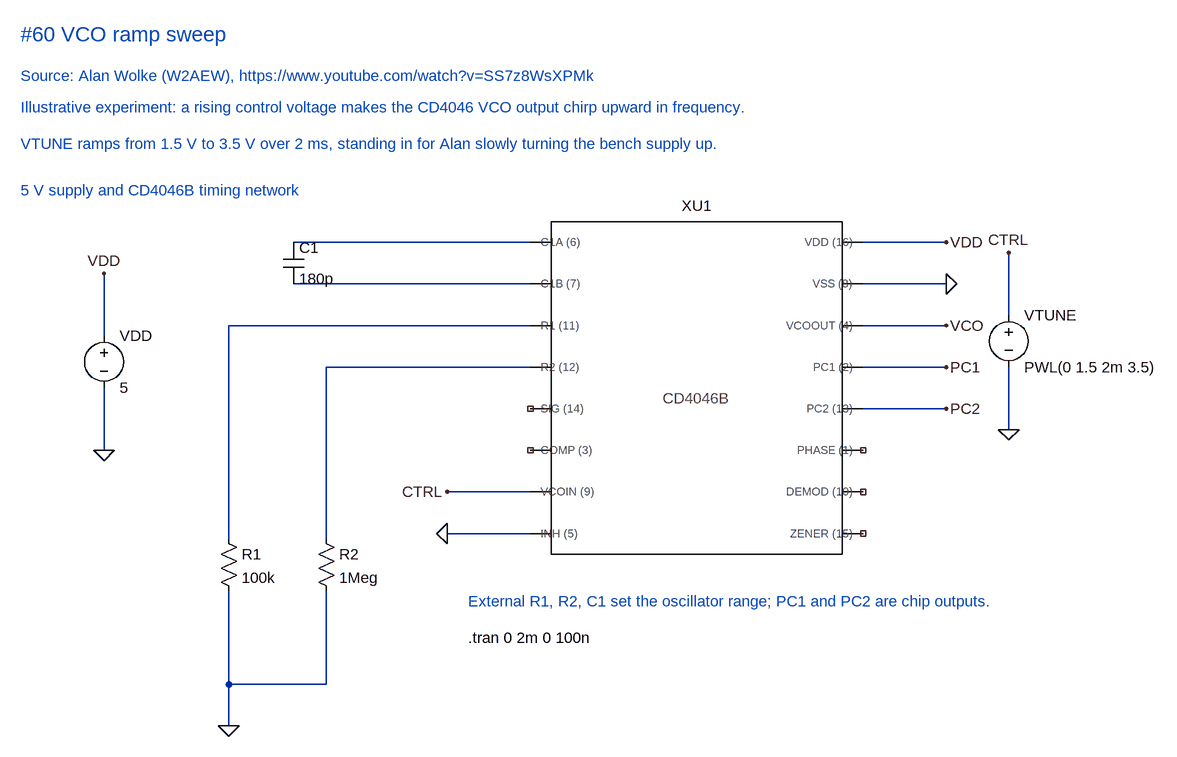
[diagram p0: schematic VCO ramp sweep.asc]
VCO ramp sweep.asc, the LTspice schematic file:
Version 4.1
SHEET 1 3100 1900
WIRE 864 -16 500 -16
WIRE 1504 -16 1376 -16
WIRE 864 48 500 48
WIRE 1504 48 1376 48
WIRE 1600 96 1600 0
WIRE 864 112 400 112
WIRE 1504 112 1376 112
WIRE 208 128 208 32
WIRE 864 176 550 176
WIRE 1504 176 1376 176
WIRE 1504 240 1376 240
WIRE 1600 272 1600 176
WIRE 208 304 208 208
WIRE 864 368 736 368
WIRE 864 432 736 432
WIRE 400 440 400 112
WIRE 550 440 550 176
WIRE 400 664 400 520
WIRE 550 664 550 520
WIRE 550 664 400 664
WIRE 400 728 400 664
FLAG 208 32 VDD
FLAG 208 304 0
FLAG 400 728 0
FLAG 736 368 CTRL
FLAG 736 432 0
FLAG 1504 -16 VDD
FLAG 1504 48 0
FLAG 1504 112 VCO
FLAG 1504 176 PC1
FLAG 1504 240 PC2
FLAG 1600 0 CTRL
FLAG 1600 272 0
SYMBOL voltage 208 112 R0
SYMATTR InstName VDD
SYMATTR Value 5
SYMBOL cap 484 -16 R0
SYMATTR InstName C1
SYMATTR Value 180p
SYMBOL res 384 424 R0
SYMATTR InstName R1
SYMATTR Value 100k
SYMBOL res 534 424 R0
SYMATTR InstName R2
SYMATTR Value 1Meg
SYMBOL ..\..\LTspice\Symbols\CD4046_board 1120 -16 R0
SYMATTR InstName XU1
SYMBOL voltage 1600 80 R0
SYMATTR InstName VTUNE
SYMATTR Value PWL(0 1.5 2m 3.5)
TEXT 80 -168 Left 2 ;VTUNE ramps from 1.5 V to 3.5 V over 2 ms, standing in for Alan slowly turning the bench supply up.
TEXT 80 -96 Left 2 ;5 V supply and CD4046B timing network
TEXT 768 536 Left 2 ;External R1, R2, C1 set the oscillator range; PC1 and PC2 are chip outputs.
TEXT 768 592 Left 2 !.tran 0 2m 0 100n
TEXT 80 -336 Left 3 ;#60 VCO ramp sweep
TEXT 80 -272 Left 2 ;Source: Alan Wolke (W2AEW), https://www.youtube.com/watch?v=SS7z8WsXPMk
TEXT 80 -224 Left 2 ;Illustrative experiment: a rising control voltage makes the CD4046 VCO output chirp upward in frequency.

The netlist it stands for:
* VCO ramp sweep.asc
VDD VDD 0 5
C1 N001 N002 180p
R1 N003 0 100k
R2 N004 0 1Meg
X§XU1 N001 N002 NC_01 0 N003 N004 NC_02 CTRL VDD 0 NC_03 PC1 PC2 NC_04 VCO NC_05 CD4046Bg  ; pins C1A_(6) C1B_(7) COMP_(3) INH_(5) R1_(11) R2_(12) SIG_(14) VCOIN_(9) VDD_(16) VSS_(8) DEMOD_(10) PC1_(2) PC2_(13) PHASE_(1) VCOOUT_(4) ZENER_(15)
VTUNE CTRL 0 PWL(0 1.5 2m 3.5)
* VTUNE ramps from 1.5 V to 3.5 V over 2 ms, standing in for Alan slowly turning the bench supply up.
* 5 V supply and CD4046B timing network
* External R1, R2, C1 set the oscillator range; PC1 and PC2 are chip outputs.
.tran 0 2m 0 100n
* #60 VCO ramp sweep
* Source: Alan Wolke (W2AEW), https://www.youtube.com/watch?v=SS7z8WsXPMk
* Illustrative experiment: a rising control voltage makes the CD4046 VCO output chirp upward in frequency.
.lib ..\..\LTspice\Models\Community\CD4046Bg-corrected.sub
.backanno
.end